# EAGLE schematic TURBIDITY_v31 (EAGLE 9.6.2)
Turbidity probe v3.1 - ESP32 direct solder wiring
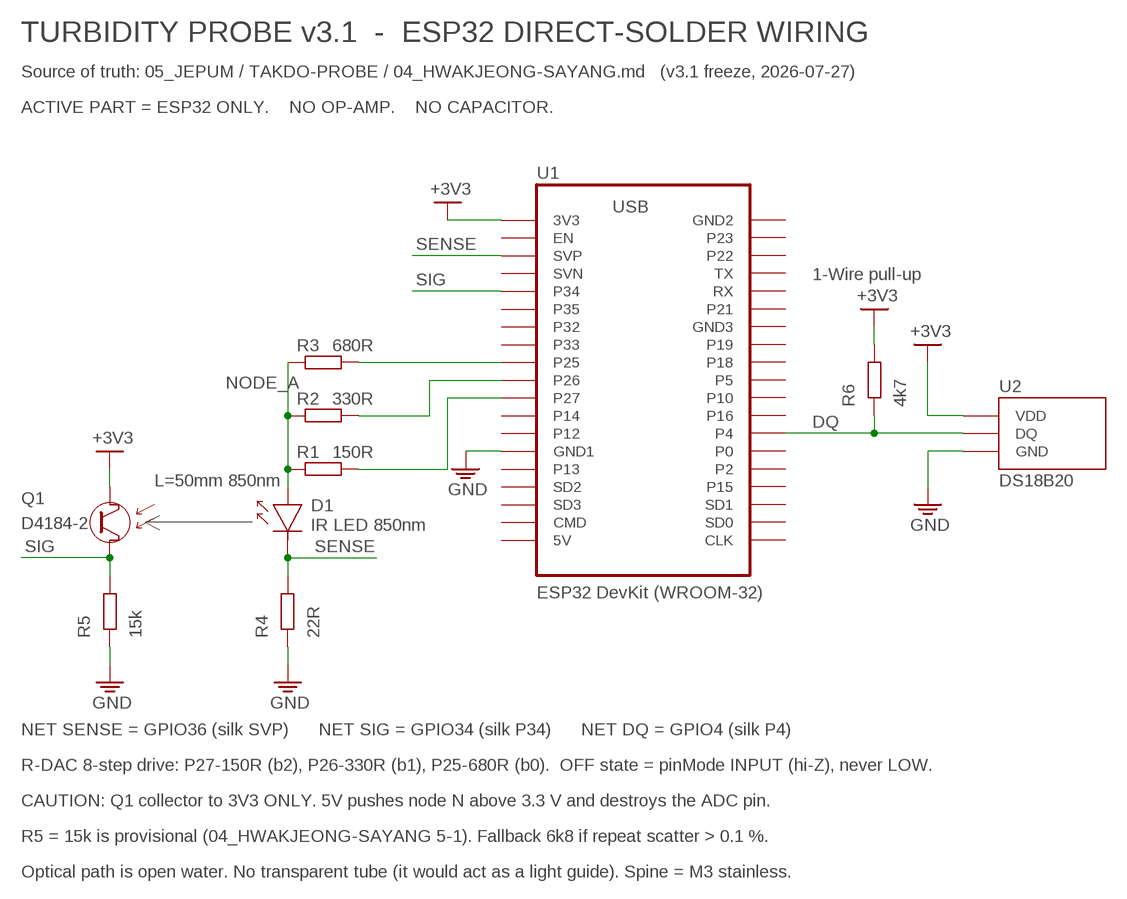
[diagram p0: schematic, sheet 1]

## Parts
D1  IR LED 850nm  LED  (no package)
Q1  D4184-2  PHOTOTRANS  (no package)
R1  150R  R  (no package)
R2  330R  R  (no package)
R3  680R  R  (no package)
R4  22R  R  (no package)
R5  15k  R  (no package)
R6  4k7  R  (no package)
U1  ESP32 DevKit (WROOM-32)  ESP32DEVKIT  (no package)
U2  DS18B20  (no package)

## Nets
+3V3: Q1.C R6.2 U1.3V3 U2.VDD
DQ: R6.1 U1.P4 U2.DQ
GND: R4.1 R5.1 U1.GND1 U2.GND
GPIO25: R3.2 U1.P25
GPIO26: R2.2 U1.P26
GPIO27: R1.2 U1.P27
NODE_A: D1.A R1.1 R2.1 R3.1
SENSE: D1.C R4.2 U1.SVP
SIG: Q1.E R5.2 U1.P34
Unconnected: U1.5V U1.CLK U1.CMD U1.EN U1.GND2 U1.GND3 U1.P0 U1.P2 U1.P5 U1.P10 U1.P12 U1.P13 U1.P14 U1.P15 U1.P16 U1.P18 U1.P19 U1.P21 U1.P22 U1.P23 U1.P32 U1.P33 U1.P35 U1.RX U1.SD0 U1.SD1 U1.SD2 U1.SD3 U1.SVN U1.TX

## Notes on the sheet
- TURBIDITY PROBE v3.1  -  ESP32 DIRECT-SOLDER WIRING
- Source of truth: 05_JEPUM / TAKDO-PROBE / 04_HWAKJEONG-SAYANG.md   (v3.1 freeze, 2026-07-27)
- ACTIVE PART = ESP32 ONLY.    NO OP-AMP.    NO CAPACITOR.
- 1-Wire pull-up
- L=50mm 850nm
- NET SENSE = GPIO36 (silk SVP)      NET SIG = GPIO34 (silk P34)      NET DQ = GPIO4 (silk P4)
- R-DAC 8-step drive: P27-150R (b2), P26-330R (b1), P25-680R (b0).  OFF state = pinMode INPUT (hi-Z), never LOW.
- CAUTION: Q1 collector to 3V3 ONLY. 5V pushes node N above 3.3 V and destroys the ADC pin.
- R5 = 15k is provisional (04_HWAKJEONG-SAYANG 5-1). Fallback 6k8 if repeat scatter > 0.1 %.
- Optical path is open water. No transparent tube (it would act as a light guide). Spine = M3 stainless.

## Library data of the parts
D1 = FISHDO:LED
Q1 = FISHDO:PHOTOTRANS
R1-R6 = FISHDO:R
U1 = FISHDO:ESP32DEVKIT
U2 = FISHDO:DS18B20